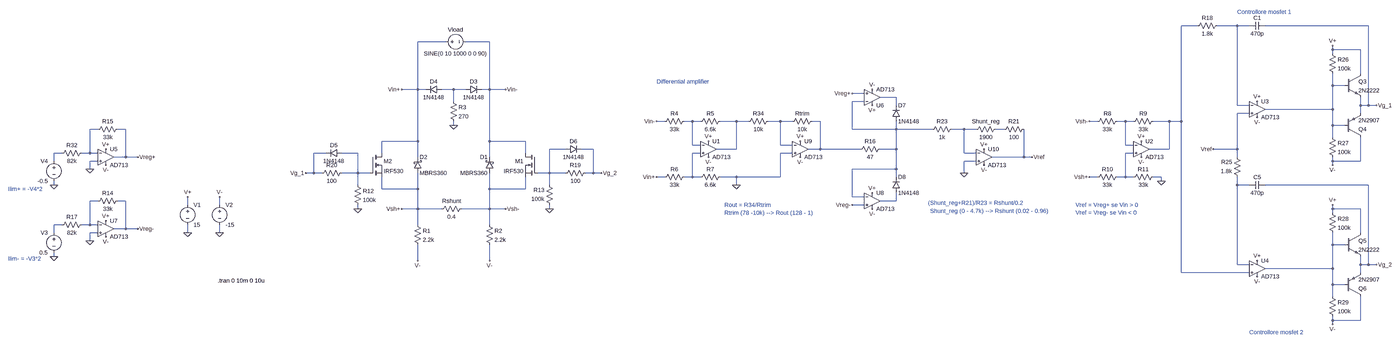
[diagram p0: schematic Electronic load.asc, whole sheet]
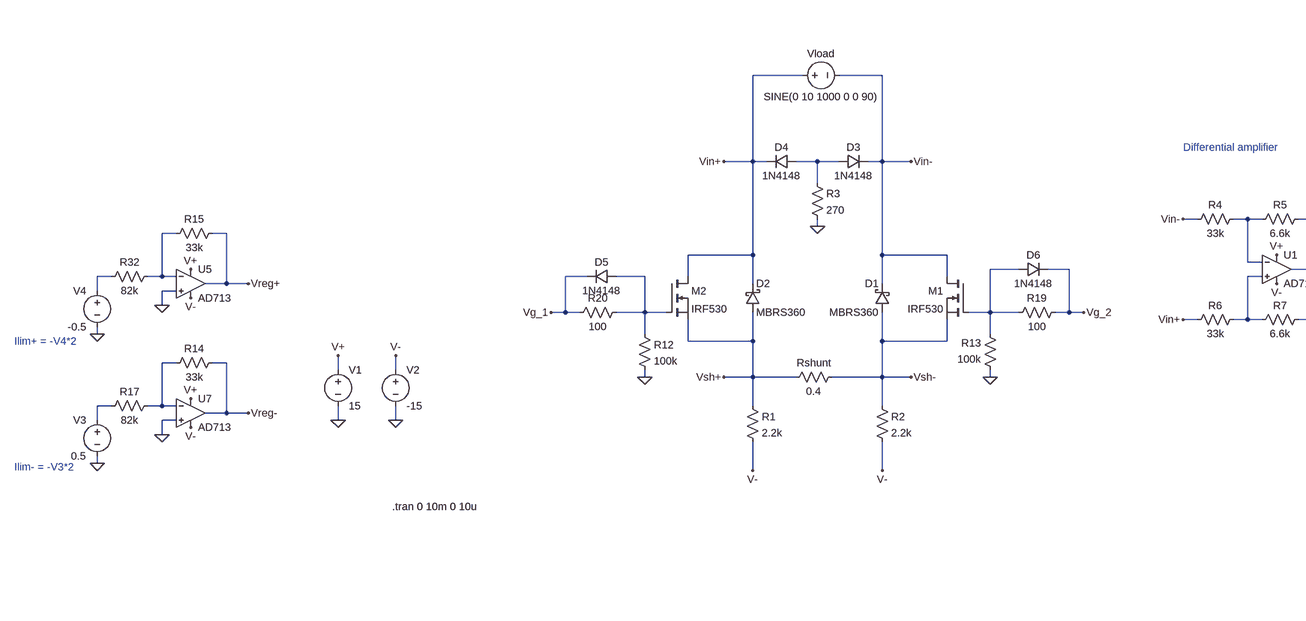
[diagram p1: schematic Electronic load.asc, part, row 1 of 1, column 1 of 2]
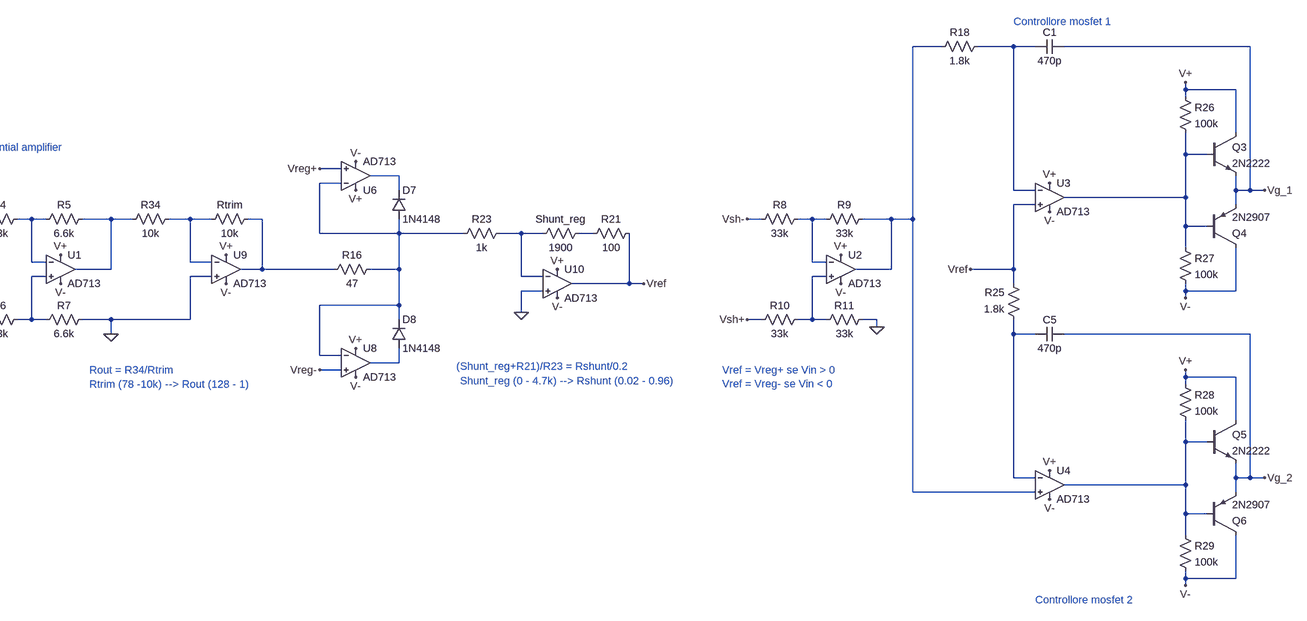
[diagram p2: schematic Electronic load.asc, part, row 1 of 1, column 2 of 2]
Electronic load.asc, the LTspice schematic file:
Version 4
SHEET 1 4616 896
WIRE 3072 -560 3008 -560
WIRE 3232 -560 3152 -560
WIRE 3280 -560 3232 -560
WIRE 3888 -560 3344 -560
WIRE -144 -496 -256 -496
WIRE 32 -496 -64 -496
WIRE 3744 -464 3744 -480
WIRE 3856 -464 3744 -464
WIRE 3744 -448 3744 -464
WIRE 3856 -368 3856 -464
WIRE 3744 -320 3744 -368
WIRE 3792 -320 3744 -320
WIRE -256 -304 -256 -496
WIRE -256 -304 -320 -304
WIRE -224 -304 -256 -304
WIRE -112 -304 -160 -304
WIRE -64 -304 -112 -304
WIRE 32 -304 32 -496
WIRE 32 -304 0 -304
WIRE 96 -304 32 -304
WIRE 1616 -288 1568 -288
WIRE 1744 -272 1680 -272
WIRE -112 -256 -112 -304
WIRE 1616 -256 1568 -256
WIRE 1744 -240 1744 -272
WIRE 3232 -240 3232 -560
WIRE 3280 -240 3232 -240
WIRE 3856 -240 3856 -272
WIRE 3888 -240 3888 -560
WIRE 3888 -240 3856 -240
WIRE 3920 -240 3888 -240
WIRE 3744 -224 3744 -320
WIRE 3744 -224 3344 -224
WIRE 3280 -208 3232 -208
WIRE 3856 -208 3856 -240
WIRE 816 -176 784 -176
WIRE 928 -176 896 -176
WIRE 960 -176 928 -176
WIRE 1104 -176 1040 -176
WIRE 1152 -176 1104 -176
WIRE 1280 -176 1232 -176
WIRE 1328 -176 1280 -176
WIRE 1440 -176 1408 -176
WIRE 2672 -176 2640 -176
WIRE 2784 -176 2752 -176
WIRE 2816 -176 2784 -176
WIRE 2960 -176 2896 -176
WIRE 3008 -176 3008 -560
WIRE 3008 -176 2960 -176
WIRE -112 -160 -112 -176
WIRE 3744 -160 3744 -224
WIRE 3792 -160 3744 -160
WIRE -1664 -144 -1696 -144
WIRE -1552 -144 -1584 -144
WIRE 1568 -144 1568 -256
WIRE 1744 -144 1744 -176
WIRE 1744 -144 1568 -144
WIRE 1888 -144 1744 -144
WIRE 2016 -144 1968 -144
WIRE 2064 -144 2016 -144
WIRE 2176 -144 2144 -144
WIRE 3744 -112 3744 -160
WIRE -256 -96 -256 -304
WIRE -256 -96 -400 -96
WIRE 32 -96 32 -304
WIRE 176 -96 32 -96
WIRE 928 -80 928 -176
WIRE 960 -80 928 -80
WIRE 1280 -80 1280 -176
WIRE 1328 -80 1280 -80
WIRE 2784 -80 2784 -176
WIRE 2816 -80 2784 -80
WIRE 336 -64 272 -64
WIRE 448 -64 400 -64
WIRE 1104 -64 1104 -176
WIRE 1104 -64 1024 -64
WIRE 1440 -64 1440 -176
WIRE 1440 -64 1392 -64
WIRE 1600 -64 1440 -64
WIRE 1744 -64 1744 -144
WIRE 1744 -64 1680 -64
WIRE 2960 -64 2960 -176
WIRE 2960 -64 2880 -64
WIRE 3232 -64 3232 -208
WIRE 3232 -64 3136 -64
WIRE -1808 -48 -1840 -48
WIRE -1696 -48 -1696 -144
WIRE -1696 -48 -1728 -48
WIRE -1664 -48 -1696 -48
WIRE -624 -48 -672 -48
WIRE -496 -48 -560 -48
WIRE -400 -48 -400 -96
WIRE 176 -48 176 -96
WIRE 960 -48 928 -48
WIRE 1328 -48 1280 -48
WIRE 2016 -48 2016 -144
WIRE 2064 -48 2016 -48
WIRE 2816 -48 2784 -48
WIRE -1552 -32 -1552 -144
WIRE -1552 -32 -1600 -32
WIRE -1504 -32 -1552 -32
WIRE -256 -32 -256 -96
WIRE 32 -32 32 -96
WIRE 2256 -32 2256 -144
WIRE 2256 -32 2128 -32
WIRE 2288 -32 2256 -32
WIRE 3232 -32 3232 -64
WIRE -1840 -16 -1840 -48
WIRE -1664 -16 -1696 -16
WIRE 2064 -16 2016 -16
WIRE 3744 -16 3744 -32
WIRE 3856 -16 3856 -112
WIRE 3856 -16 3744 -16
WIRE 3744 0 3744 -16
WIRE -1696 16 -1696 -16
WIRE 1744 16 1744 -64
WIRE 1744 16 1568 16
WIRE -672 32 -672 -48
WIRE -672 32 -704 32
WIRE -640 32 -672 32
WIRE -496 32 -496 -48
WIRE -496 32 -560 32
WIRE -448 32 -496 32
WIRE 272 32 272 -64
WIRE 272 32 224 32
WIRE 336 32 272 32
WIRE 448 32 448 -64
WIRE 448 32 416 32
WIRE 480 32 448 32
WIRE 2016 32 2016 -16
WIRE 816 48 784 48
WIRE 928 48 928 -48
WIRE 928 48 896 48
WIRE 960 48 928 48
WIRE 1104 48 1040 48
WIRE 1280 48 1280 -48
WIRE 1280 48 1104 48
WIRE 1744 48 1744 16
WIRE 2672 48 2640 48
WIRE 2784 48 2784 -48
WIRE 2784 48 2752 48
WIRE 2816 48 2784 48
WIRE 2928 48 2896 48
WIRE 2928 64 2928 48
WIRE -1840 80 -1840 64
WIRE -496 80 -496 32
WIRE 272 80 272 32
WIRE 1104 80 1104 48
WIRE 3232 80 3232 48
WIRE 3280 80 3232 80
WIRE 3888 80 3344 80
WIRE -400 96 -400 48
WIRE -256 96 -256 32
WIRE -256 96 -400 96
WIRE 32 96 32 32
WIRE 176 96 176 48
WIRE 176 96 32 96
WIRE 1568 128 1568 16
WIRE 1616 128 1568 128
WIRE -1664 144 -1696 144
WIRE -1552 144 -1584 144
WIRE 1744 144 1744 112
WIRE 1744 144 1680 144
WIRE -1216 160 -1216 128
WIRE -1088 160 -1088 128
WIRE 1616 160 1568 160
WIRE -496 176 -496 160
WIRE -256 176 -256 96
WIRE -256 176 -320 176
WIRE -160 176 -256 176
WIRE 32 176 32 96
WIRE 32 176 -80 176
WIRE 96 176 32 176
WIRE 272 176 272 160
WIRE 3744 176 3744 160
WIRE 3856 176 3744 176
WIRE 3744 192 3744 176
WIRE -1808 240 -1840 240
WIRE -1696 240 -1696 144
WIRE -1696 240 -1728 240
WIRE -1664 240 -1696 240
WIRE -256 240 -256 176
WIRE 32 240 32 176
WIRE -1552 256 -1552 144
WIRE -1552 256 -1600 256
WIRE -1504 256 -1552 256
WIRE -1840 272 -1840 240
WIRE -1664 272 -1696 272
WIRE -1216 272 -1216 240
WIRE -1088 272 -1088 240
WIRE 3856 272 3856 176
WIRE -1696 304 -1696 272
WIRE 3744 320 3744 272
WIRE 3792 320 3744 320
WIRE -1840 368 -1840 352
WIRE -256 384 -256 320
WIRE 32 384 32 320
WIRE 3232 400 3232 80
WIRE 3280 400 3232 400
WIRE 3856 400 3856 368
WIRE 3888 400 3888 80
WIRE 3888 400 3856 400
WIRE 3920 400 3888 400
WIRE 3744 416 3744 320
WIRE 3744 416 3344 416
WIRE 3008 432 3008 -176
WIRE 3280 432 3008 432
WIRE 3856 432 3856 400
WIRE 3744 480 3744 416
WIRE 3792 480 3744 480
WIRE 3744 528 3744 480
WIRE 3744 624 3744 608
WIRE 3856 624 3856 528
WIRE 3856 624 3744 624
WIRE 3744 640 3744 624
FLAG -1088 272 0
FLAG -1216 272 0
FLAG -1216 128 V+
FLAG -1088 128 V-
FLAG -256 384 V-
FLAG 32 384 V-
FLAG -112 -160 0
FLAG 992 -32 V-
FLAG 992 -96 V+
FLAG 1104 80 0
FLAG 2848 -32 V-
FLAG 2848 -96 V+
FLAG 2928 64 0
FLAG -320 -304 Vin+
FLAG 96 -304 Vin-
FLAG -320 176 Vsh+
FLAG 96 176 Vsh-
FLAG 784 48 Vin+
FLAG 784 -176 Vin-
FLAG 2640 48 Vsh+
FLAG 2640 -176 Vsh-
FLAG 480 32 Vg_2
FLAG 3312 -192 V-
FLAG 3312 -256 V+
FLAG 3920 -240 Vg_1
FLAG -704 32 Vg_1
FLAG 1648 -304 V-
FLAG 1648 -240 V+
FLAG 2288 -32 Vref
FLAG 3136 -64 Vref
FLAG -496 176 0
FLAG 272 176 0
FLAG 3744 -480 V+
FLAG 3744 0 V-
FLAG 3312 448 V-
FLAG 3312 384 V+
FLAG 3744 160 V+
FLAG 3744 640 V-
FLAG 3920 400 Vg_2
FLAG -1632 0 V-
FLAG -1632 -64 V+
FLAG -1504 -32 Vreg+
FLAG -1840 80 0
FLAG 1648 176 V-
FLAG 1648 112 V+
FLAG 1568 -288 Vreg+
FLAG 1568 160 Vreg-
FLAG -1696 16 0
FLAG -1632 288 V-
FLAG -1632 224 V+
FLAG -1504 256 Vreg-
FLAG -1840 368 0
FLAG -1696 304 0
FLAG 1360 -32 V-
FLAG 1360 -96 V+
FLAG 2096 0 V-
FLAG 2096 -64 V+
FLAG 2016 32 0
SYMBOL voltage -1216 144 R0
SYMATTR InstName V1
SYMATTR Value 15
SYMBOL voltage -1088 144 R0
SYMATTR InstName V2
SYMATTR Value -15
SYMBOL nmos 224 -48 M0
SYMATTR InstName M1
SYMATTR Value IRF530
SYMBOL nmos -448 -48 R0
SYMATTR InstName M2
SYMATTR Value IRF530
SYMBOL schottky -272 32 M180
WINDOW 0 24 64 Left 2
WINDOW 3 24 0 Left 2
SYMATTR InstName D2
SYMATTR Value MBRS360
SYMATTR Description Diode
SYMATTR Type diode
SYMBOL res -176 192 R270
WINDOW 0 32 56 VTop 2
WINDOW 3 0 56 VBottom 2
SYMATTR InstName Rshunt
SYMATTR Value 0.4
SYMBOL res -272 224 R0
SYMATTR InstName R1
SYMATTR Value 2.2k
SYMBOL res 16 224 R0
SYMATTR InstName R2
SYMATTR Value 2.2k
SYMBOL diode -64 -320 M90
WINDOW 0 0 32 VBottom 2
WINDOW 3 32 32 VTop 2
SYMATTR InstName D3
SYMATTR Value 1N4148
SYMBOL diode -160 -288 M270
WINDOW 0 32 32 VTop 2
WINDOW 3 0 32 VBottom 2
SYMATTR InstName D4
SYMATTR Value 1N4148
SYMBOL res -128 -272 R0
SYMATTR InstName R3
SYMATTR Value 270
SYMBOL schottky 48 32 R180
WINDOW 0 24 64 Left 2
WINDOW 3 24 0 Left 2
SYMATTR InstName D1
SYMATTR Value MBRS360
SYMATTR Description Diode
SYMATTR Type diode
SYMBOL OpAmps\\AD713 992 -128 R0
SYMATTR InstName U1
SYMBOL res 912 -192 R90
WINDOW 0 0 56 VBottom 2
WINDOW 3 32 56 VTop 2
SYMATTR InstName R4
SYMATTR Value 33k
SYMBOL res 1056 -192 R90
WINDOW 0 0 56 VBottom 2
WINDOW 3 32 56 VTop 2
SYMATTR InstName R5
SYMATTR Value 6.6k
SYMBOL res 912 32 R90
WINDOW 0 0 56 VBottom 2
WINDOW 3 32 56 VTop 2
SYMATTR InstName R6
SYMATTR Value 33k
SYMBOL res 1056 32 R90
WINDOW 0 0 56 VBottom 2
WINDOW 3 32 56 VTop 2
SYMATTR InstName R7
SYMATTR Value 6.6k
SYMBOL OpAmps\\AD713 2848 -128 R0
SYMATTR InstName U2
SYMBOL res 2768 -192 R90
WINDOW 0 0 56 VBottom 2
WINDOW 3 32 56 VTop 2
SYMATTR InstName R8
SYMATTR Value 33k
SYMBOL res 2912 -192 R90
WINDOW 0 0 56 VBottom 2
WINDOW 3 32 56 VTop 2
SYMATTR InstName R9
SYMATTR Value 33k
SYMBOL res 2768 32 R90
WINDOW 0 0 56 VBottom 2
WINDOW 3 32 56 VTop 2
SYMATTR InstName R10
SYMATTR Value 33k
SYMBOL res 2912 32 R90
WINDOW 0 0 56 VBottom 2
WINDOW 3 32 56 VTop 2
SYMATTR InstName R11
SYMATTR Value 33k
SYMBOL voltage -160 -496 M90
WINDOW 0 -32 56 VBottom 2
WINDOW 3 32 56 VTop 2
WINDOW 123 0 0 Left 0
WINDOW 39 0 0 Left 0
SYMATTR InstName Vload
SYMATTR Value SINE(0 10 1000 0 0 90)
SYMBOL OpAmps\\AD713 3312 -288 R0
SYMATTR InstName U3
SYMBOL res 432 16 R90
WINDOW 0 0 56 VBottom 2
WINDOW 3 32 56 VTop 2
SYMATTR InstName R19
SYMATTR Value 100
SYMBOL res -656 48 R270
WINDOW 0 32 56 VTop 2
WINDOW 3 0 56 VBottom 2
SYMATTR InstName R20
SYMATTR Value 100
SYMBOL cap 3344 -576 R90
WINDOW 0 0 32 VBottom 2
WINDOW 3 32 32 VTop 2
SYMATTR InstName C1
SYMATTR Value 470p
SYMBOL res 3168 -576 R90
WINDOW 0 0 56 VBottom 2
WINDOW 3 32 56 VTop 2
SYMATTR InstName R18
SYMATTR Value 1.8k
SYMBOL OpAmps\\AD713 1648 -208 M180
SYMATTR InstName U6
SYMBOL res -512 64 R0
SYMATTR InstName R12
SYMATTR Value 100k
SYMBOL res 288 176 R180
WINDOW 0 36 76 Left 2
WINDOW 3 36 40 Left 2
SYMATTR InstName R13
SYMATTR Value 100k
SYMBOL diode -560 -32 M270
WINDOW 0 32 32 VTop 2
WINDOW 3 0 32 VBottom 2
SYMATTR InstName D5
SYMATTR Value 1N4148
SYMBOL diode 336 -80 M90
WINDOW 0 0 32 VBottom 2
WINDOW 3 32 32 VTop 2
SYMATTR InstName D6
SYMATTR Value 1N4148
SYMBOL npn 3792 -368 R0
SYMATTR InstName Q3
SYMATTR Value 2N2222
SYMBOL pnp 3792 -112 M180
SYMATTR InstName Q4
SYMATTR Value 2N2907
SYMBOL res 3728 -464 R0
SYMATTR InstName R26
SYMATTR Value 100k
SYMBOL res 3728 -128 R0
SYMATTR InstName R27
SYMATTR Value 100k
SYMBOL OpAmps\\AD713 3312 352 R0
SYMATTR InstName U4
SYMBOL cap 3344 64 R90
WINDOW 0 0 32 VBottom 2
WINDOW 3 32 32 VTop 2
SYMATTR InstName C5
SYMATTR Value 470p
SYMBOL res 3248 64 R180
WINDOW 0 36 76 Left 2
WINDOW 3 36 40 Left 2
SYMATTR InstName R25
SYMATTR Value 1.8k
SYMBOL npn 3792 272 R0
SYMATTR InstName Q5
SYMATTR Value 2N2222
SYMBOL pnp 3792 528 M180
SYMATTR InstName Q6
SYMATTR Value 2N2907
SYMBOL res 3728 176 R0
SYMATTR InstName R28
SYMATTR Value 100k
SYMBOL res 3728 512 R0
SYMATTR InstName R29
SYMATTR Value 100k
SYMBOL OpAmps\\AD713 -1632 -96 R0
SYMATTR InstName U5
SYMBOL res -1568 -160 R90
WINDOW 0 0 56 VBottom 2
WINDOW 3 32 56 VTop 2
SYMATTR InstName R15
SYMATTR Value 33k
SYMBOL voltage -1840 -32 M0
WINDOW 123 0 0 Left 0
WINDOW 39 0 0 Left 0
SYMATTR InstName V4
SYMATTR Value -0.5
SYMBOL res -1824 -32 R270
WINDOW 0 32 56 VTop 2
WINDOW 3 0 56 VBottom 2
SYMATTR InstName R32
SYMATTR Value 82k
SYMBOL diode 1728 -176 M180
WINDOW 0 24 64 Left 2
WINDOW 3 24 0 Left 2
SYMATTR InstName D7
SYMATTR Value 1N4148
SYMBOL OpAmps\\AD713 1648 80 R0
SYMATTR InstName U8
SYMBOL diode 1728 112 M180
WINDOW 0 24 64 Left 2
WINDOW 3 24 0 Left 2
SYMATTR InstName D8
SYMATTR Value 1N4148
SYMBOL res 1696 -80 R90
WINDOW 0 0 56 VBottom 2
WINDOW 3 32 56 VTop 2
SYMATTR InstName R16
SYMATTR Value 47
SYMBOL res 1248 -192 R90
WINDOW 0 0 56 VBottom 2
WINDOW 3 32 56 VTop 2
SYMATTR InstName R34
SYMATTR Value 10k
SYMBOL res 1424 -192 R90
WINDOW 0 0 56 VBottom 2
WINDOW 3 32 56 VTop 2
SYMATTR InstName Rtrim
SYMATTR Value 10k
SYMBOL OpAmps\\AD713 -1632 192 R0
SYMATTR InstName U7
SYMBOL res -1568 128 R90
WINDOW 0 0 56 VBottom 2
WINDOW 3 32 56 VTop 2
SYMATTR InstName R14
SYMATTR Value 33k
SYMBOL voltage -1840 256 M0
WINDOW 123 0 0 Left 0
WINDOW 39 0 0 Left 0
SYMATTR InstName V3
SYMATTR Value 0.5
SYMBOL res -1824 256 R270
WINDOW 0 32 56 VTop 2
WINDOW 3 0 56 VBottom 2
SYMATTR InstName R17
SYMATTR Value 82k
SYMBOL OpAmps\\AD713 1360 -128 R0
SYMATTR InstName U9
SYMBOL res 1984 -160 R90
WINDOW 0 0 56 VBottom 2
WINDOW 3 32 56 VTop 2
SYMATTR InstName R23
SYMATTR Value 1k
SYMBOL res 2160 -160 R90
WINDOW 0 0 56 VBottom 2
WINDOW 3 32 56 VTop 2
SYMATTR InstName Shunt_reg
SYMATTR Value 1900
SYMBOL OpAmps\\AD713 2096 -96 R0
SYMATTR InstName U10
SYMBOL res 2272 -160 R90
WINDOW 0 0 56 VBottom 2
WINDOW 3 32 56 VTop 2
SYMATTR InstName R21
SYMATTR Value 100
TEXT -1096 464 Left 2 !.tran 0 10m 0 10u
TEXT 2584 160 Left 2 ;Vref = Vreg+ se Vin > 0\nVref = Vreg- se Vin < 0
TEXT 784 -336 Left 2 ;Differential amplifier
TEXT 3232 -616 Left 2 ;Controllore mosfet 1
TEXT 3280 672 Left 2 ;Controllore mosfet 2
TEXT 1056 192 Left 2 ;Rtrim (78 -10k) --> Rout (128 - 1)
TEXT 1056 160 Left 2 ;Rout = R34/Rtrim
TEXT -2024 96 Left 2 ;Ilim+ = -V4*2
TEXT -2024 376 Left 2 ;Ilim- = -V3*2
TEXT 1872 152 Left 2 ;(Shunt_reg+R21)/R23 = Rshunt/0.2
TEXT 1880 184 Left 2 ;Shunt_reg (0 - 4.7k) --> Rshunt (0.02 - 0.96)

The netlist it stands for:
* Electronic load.asc
V1 V+ 0 15
V2 V- 0 -15
M1 Vin- N015 Vsh- Vsh- IRF530
M2 Vin+ N017 Vsh+ Vsh+ IRF530
D2 Vsh+ Vin+ MBRS360
Rshunt Vsh+ Vsh- 0.4
R1 Vsh+ V- 2.2k
R2 Vsh- V- 2.2k
D3 N004 Vin- 1N4148
D4 N004 Vin+ 1N4148
R3 N004 0 270
D1 Vsh- Vin- MBRS360
XU1 N018 N007 V+ V- N008 AD712  ; AD713, pins In+ In- V+ V- OUT
R4 N007 Vin- 33k
R5 N008 N007 6.6k
R6 N018 Vin+ 33k
R7 0 N018 6.6k
XU2 N019 N011 V+ V- N001 AD712  ; AD713, pins In+ In- V+ V- OUT
R8 N011 Vsh- 33k
R9 N001 N011 33k
R10 N019 Vsh+ 33k
R11 0 N019 33k
Vload Vin+ Vin- SINE(0 10 1000 0 0 90)
XU3 Vref N002 V+ V- N003 AD712  ; AD713, pins In+ In- V+ V- OUT
R19 Vg_2 N015 100
R20 Vg_1 N017 100
C1 Vg_1 N002 470p
R18 N002 N001 1.8k
XU6 Vreg+ N006 V+ V- N005 AD712  ; AD713, pins In+ In- V+ V- OUT
R12 N017 0 100k
R13 0 N015 100k
D5 N017 Vg_1 1N4148
D6 N015 Vg_2 1N4148
Q3 V+ N003 Vg_1 0 2N2222
Q4 V- N003 Vg_1 0 2N2907
R26 V+ N003 100k
R27 N003 V- 100k
XU4 N001 N020 V+ V- N024 AD712  ; AD713, pins In+ In- V+ V- OUT
C5 Vg_2 N020 470p
R25 N020 Vref 1.8k
Q5 V+ N024 Vg_2 0 2N2222
Q6 V- N024 Vg_2 0 2N2907
R28 V+ N024 100k
R29 N024 V- 100k
XU5 0 N012 V+ V- Vreg+ AD712  ; AD713, pins In+ In- V+ V- OUT
R15 Vreg+ N012 33k
V4 N016 0 -0.5
R32 N016 N012 82k
D7 N006 N005 1N4148
XU8 Vreg- N006 V+ V- N022 AD712  ; AD713, pins In+ In- V+ V- OUT
D8 N022 N006 1N4148
R16 N006 N010 47
R34 N009 N008 10k
Rtrim N010 N009 10k
XU7 0 N021 V+ V- Vreg- AD712  ; AD713, pins In+ In- V+ V- OUT
R14 Vreg- N021 33k
V3 N023 0 0.5
R17 N023 N021 82k
XU9 0 N009 V+ V- N010 AD712  ; AD713, pins In+ In- V+ V- OUT
R23 N013 N006 1k
R§Shunt_reg N014 N013 1900
XU10 0 N013 V+ V- Vref AD712  ; AD713, pins In+ In- V+ V- OUT
R21 Vref N014 100
.model D D
.lib standard.dio
.model NPN NPN
.model PNP PNP
.lib standard.bjt
.model NMOS NMOS
.model PMOS PMOS
.lib standard.mos
.tran 0 10m 0 10u
* Vref = Vreg+ se Vin > 0
* Vref = Vreg- se Vin < 0
* Differential amplifier
* Controllore mosfet 1
* Controllore mosfet 2
* Rtrim (78 -10k) --> Rout (128 - 1)
* Rout = R34/Rtrim
* Ilim+ = -V4*2
* Ilim- = -V3*2
* (Shunt_reg+R21)/R23 = Rshunt/0.2
* Shunt_reg (0 - 4.7k) --> Rshunt (0.02 - 0.96)
.lib ADI1.lib
.backanno
.end